# EAGLE design ECG_final_project (EAGLE 9.6.2)
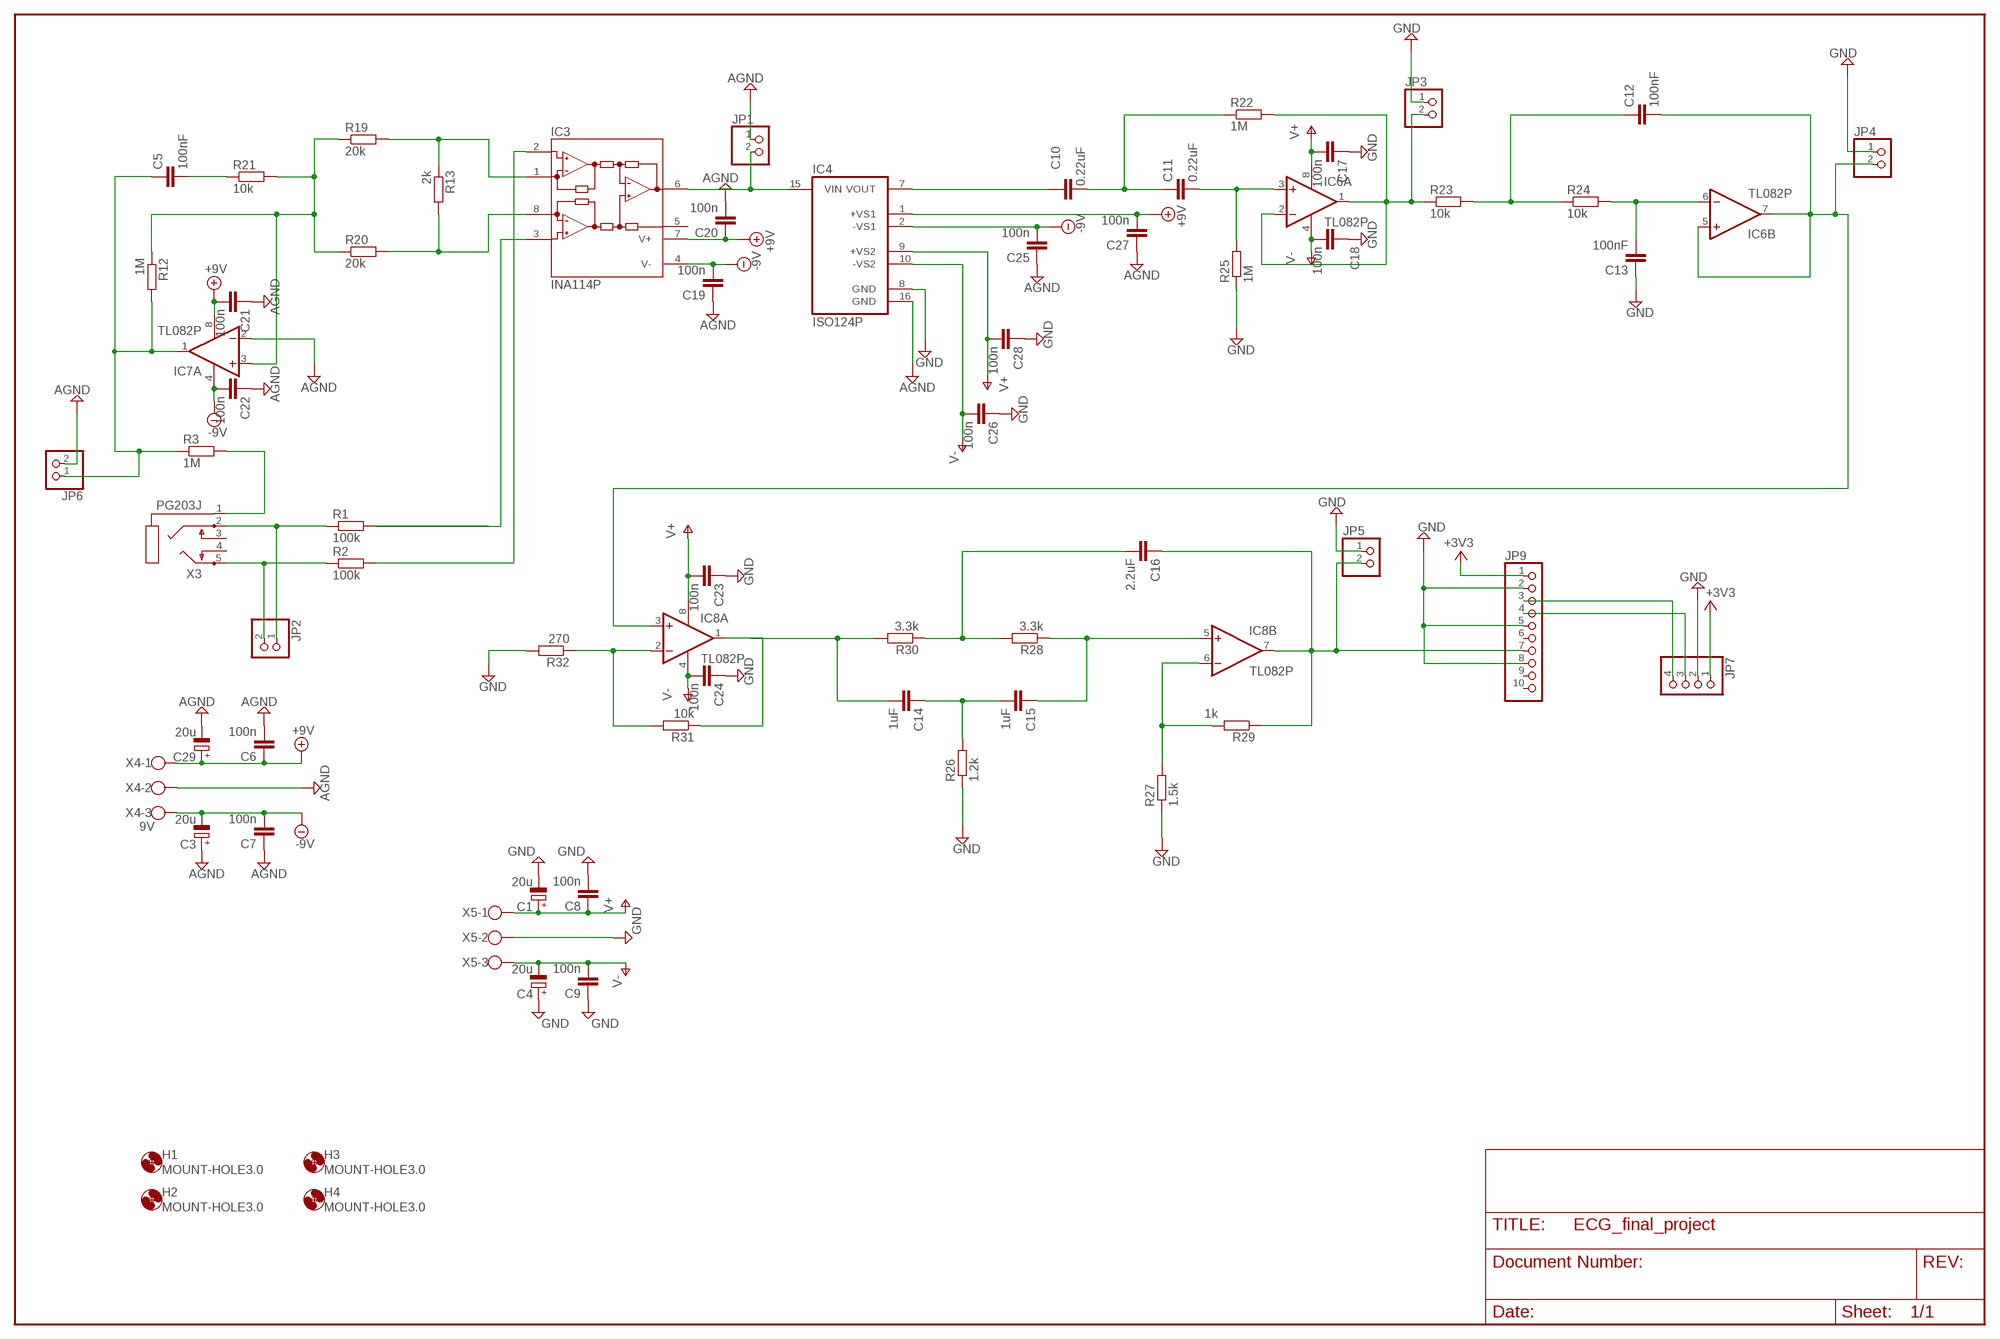
[diagram p0: schematic, sheet 1]

## Parts
C1  20u  CPOL-EUE2,5-6E  [E2,5-6E]
C3  20u  CPOL-EUE2,5-6E  [E2,5-6E]
C4  20u  CPOL-EUE2,5-6E  [E2,5-6E]
C5  100nF  C-EU025-025X050  [C025-025X050]
C6  100n  C-EU025-025X050  [C025-025X050]
C7  100n  C-EU025-025X050  [C025-025X050]
C8  100n  C-EU025-025X050  [C025-025X050]
C9  100n  C-EU025-025X050  [C025-025X050]
C10  0.22uF  C-EU025-025X050  [C025-025X050]
C11  0.22uF  C-EU025-025X050  [C025-025X050]
C12  100nF  C-EU025-025X050  [C025-025X050]
C13  100nF  C-EU025-025X050  [C025-025X050]
C14  1uF  C-EU025-025X050  [C025-025X050]
C15  1uF  C-EU025-025X050  [C025-025X050]
C16  2.2uF  C-EU025-025X050  [C025-025X050]
C17  100n  C-EU025-025X050  [C025-025X050]
C18  100n  C-EU025-025X050  [C025-025X050]
C19  100n  C-EU025-025X050  [C025-025X050]
C20  100n  C-EU025-025X050  [C025-025X050]
C21  100n  C-EU025-025X050  [C025-025X050]
C22  100n  C-EU025-025X050  [C025-025X050]
C23  100n  C-EU025-025X050  [C025-025X050]
C24  100n  C-EU025-025X050  [C025-025X050]
C25  100n  C-EU025-025X050  [C025-025X050]
C26  100n  C-EU025-025X050  [C025-025X050]
C27  100n  C-EU025-025X050  [C025-025X050]
C28  100n  C-EU025-025X050  [C025-025X050]
C29  20u  CPOL-EUE2,5-6E  [E2,5-6E]
H1  MOUNT-HOLE3.0  [3,0]
H2  MOUNT-HOLE3.0  [3,0]
H3  MOUNT-HOLE3.0  [3,0]
H4  MOUNT-HOLE3.0  [3,0]
IC3  INA114P  [DIL08]
IC4  ISO124P  [DIL16/8]
IC6  TL082P  [DIL08]
IC7  TL082P  [DIL08]
IC8  TL082P  [DIL08]
JP1  PINHD-1X2  [1X02]
JP2  PINHD-1X2  [1X02]
JP3  PINHD-1X2  [1X02]
JP4  PINHD-1X2  [1X02]
JP5  PINHD-1X2  [1X02]
JP6  PINHD-1X2  [1X02]
JP7  PINHD-1X4  [1X04]
JP9  PINHD-1X10  [1X10]
R1  100k  R-EU_0207/10  [0207/10]
R2  100k  R-EU_0207/10  [0207/10]
R3  1M  R-EU_0207/10  [0207/10]
R12  1M  R-EU_0207/10  [0207/10]
R13  2k  R-EU_0207/10  [0207/10]
R19  20k  R-EU_0207/10  [0207/10]
R20  20k  R-EU_0207/10  [0207/10]
R21  10k  R-EU_0207/10  [0207/10]
R22  1M  R-EU_0207/10  [0207/10]
R23  10k  R-EU_0207/10  [0207/10]
R24  10k  R-EU_0207/10  [0207/10]
R25  1M  R-EU_0207/10  [0207/10]
R26  1.2k  R-EU_0207/10  [0207/10]
R27  1.5k  R-EU_0207/10  [0207/10]
R28  3.3k  R-EU_0207/10  [0207/10]
R29  1k  R-EU_0207/10  [0207/10]
R30  3.3k  R-EU_0207/10  [0207/10]
R31  10k  R-EU_0207/10  [0207/10]
R32  270  R-EU_0207/10  [0207/10]
X3  PG203J  [PG203J]
X4  9V  W237-103  [W237-103]
X5  W237-103  [W237-103]

## Nets
+3V3: JP7.1 JP9.1
+9V: C6.1 C20.1 C21.2 C27.2 C29.+ IC3.7(V+) IC4.1(+VS1) IC7.8(P:V+) X4.1
-9V: C3.- C7.2 C19.2 C22.2 C25.2 IC3.4(V-) IC4.2(-VS1) IC7.4(P:V-) X4.3
AGND: C3.+ C6.2 C7.1 C19.1 C20.2 C21.1 C22.1 C25.1 C27.1 C29.- IC4.16(GND) IC7.2(A:-IN) JP1.1 JP6.2 X4.2
GND: C1.- C4.+ C8.2 C9.1 C13.1 C17.1 C18.1 C23.1 C24.1 C26.1 C28.1 IC4.8(GND) JP3.1 JP4.1 JP5.1 JP7.2 JP9.2 JP9.5 JP9.8 R25.1 R26.1 R27.1 R32.2 X5.2
N$1: IC7.3(A:+IN) R12.1 R19.1 R20.1 R21.2
N$2: C5.2 R21.1
N$3: C5.1 IC7.1(A:OUT) JP6.1 R3.1 R12.2
N$4: JP7.4 JP9.3
N$5: IC3.1(RG) R13.1 R19.2
N$6: IC3.8(RG) R13.2 R20.2
N$7: IC3.6(OUT) IC4.15(VIN) JP1.2
N$8: C10.1 IC4.7(VOUT)
N$9: C10.2 C11.1 R22.1
N$10: C11.2 IC6.3(A:+IN) R25.2
N$11: JP7.3 JP9.4
N$12: IC6.1(A:OUT) IC6.2(A:-IN) JP3.2 R22.2 R23.1
N$13: C12.1 R23.2 R24.1
N$14: C13.2 IC6.6(B:-IN) R24.2
N$15: C12.2 IC6.5(B:+IN) IC6.7(B:OUT) IC8.3(A:+IN) JP4.2
N$16: R3.2 X3.1
N$17: IC8.2(A:-IN) R31.2 R32.1
N$19: IC8.1(A:OUT) R31.1
N$21: C16.2 R28.2 R30.1
N$23: C16.1 IC8.7(B:OUT) JP5.2 JP9.7 R29.1
N$24: IC8.6(B:-IN) R27.2 R29.2
N$25: C14.2 R30.2
N$26: C14.1 C15.2 R26.2
N$27: C15.1 IC8.5(B:+IN) R28.1
N$29: IC3.2(-IN) R2.2
N$30: IC3.3(+IN) R1.2
N$31: JP2.1 R1.1 X3.2
N$32: JP2.2 R2.1 X3.5
V+: C1.+ C8.1 C17.2 C23.2 C28.2 IC4.9(+VS2) IC6.8(P:V+) IC8.8(P:V+) X5.1
V-: C4.- C9.2 C18.2 C24.2 C26.2 IC4.10(-VS2) IC6.4(P:V-) IC8.4(P:V-) X5.3
Unconnected: IC3.5(REF) IC7.5(B:+IN) IC7.6(B:-IN) IC7.7(B:OUT) JP9.6 JP9.9 JP9.10 X3.3 X3.4

## Library data of the parts
C1 C3 C4 C29 = rcl_coronas:CPOL-EU: POLARIZED CAPACITOR, European symbol; SPICEPREFIX: C
C5-C28 = rcl_coronas:C-EU: CAPACITOR, European symbol; SPICEPREFIX: C
H1-H4 = holes:MOUNT-HOLE: MOUNTING HOLE with drill center marker
IC3 = burr-brown:INA114: Precision Instrumentation Amplifier; MF: TEXAS INSTRUMENTS; MPN: INA114BP; OC_FARNELL: 1212399; OC_NEWARK: 74K3810
IC4 = burr-brown:ISO124: Isolation Amplifier Precision, Lowest Cost; MF: TEXAS INSTRUMENTS; MPN: ISO124P; OC_FARNELL: 1212425; OC_NEWARK: 35C1752
IC6-IC8 = linear:TL082: OP AMP Data sheet <http://www.ti.com/lit/ds/symlink/tl084a . pdf>; DATA_SHEET: <a href="http://www.ti.com/lit/ds/symlink/tl084a.pdf"> Data sheet </a>
JP1-JP6 = pinhead:PINHD-1X2: PIN HEADER
JP7 = pinhead:PINHD-1X4: PIN HEADER
JP9 = pinhead:PINHD-1X10: PIN HEADER
R1-R3 R12 R13 R19-R32 = rcl_coronas:R-EU_: RESISTOR, European symbol; SPICEPREFIX: R
X3 = con-hirschmann:PG203J: MIC/HEADPHONE JACK KS-S stereo microphone/headphone jack PG203JN (Schukat); OC_FARNELL: unknown; OC_NEWARK: unknown
X4 X5 = con-wago-500:W237-103: WAGO SCREW CLAMP; MPN: 237-103; OC_FARNELL: unknown; OC_NEWARK: 18M7116

## Board
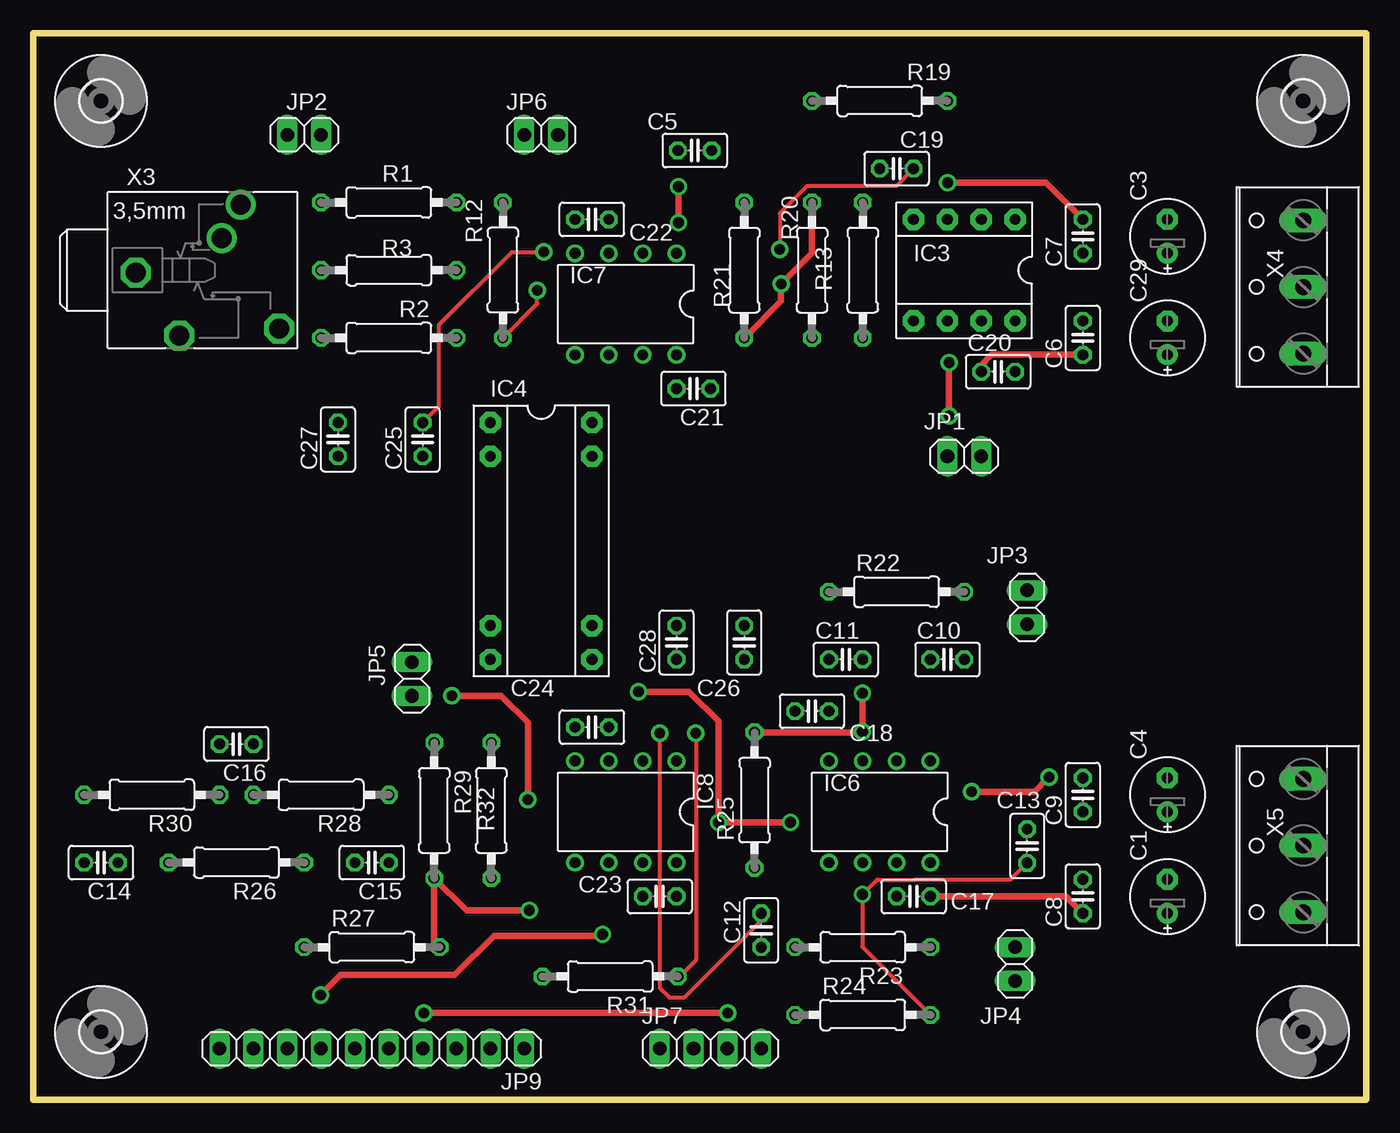
[diagram p1: board, top side]
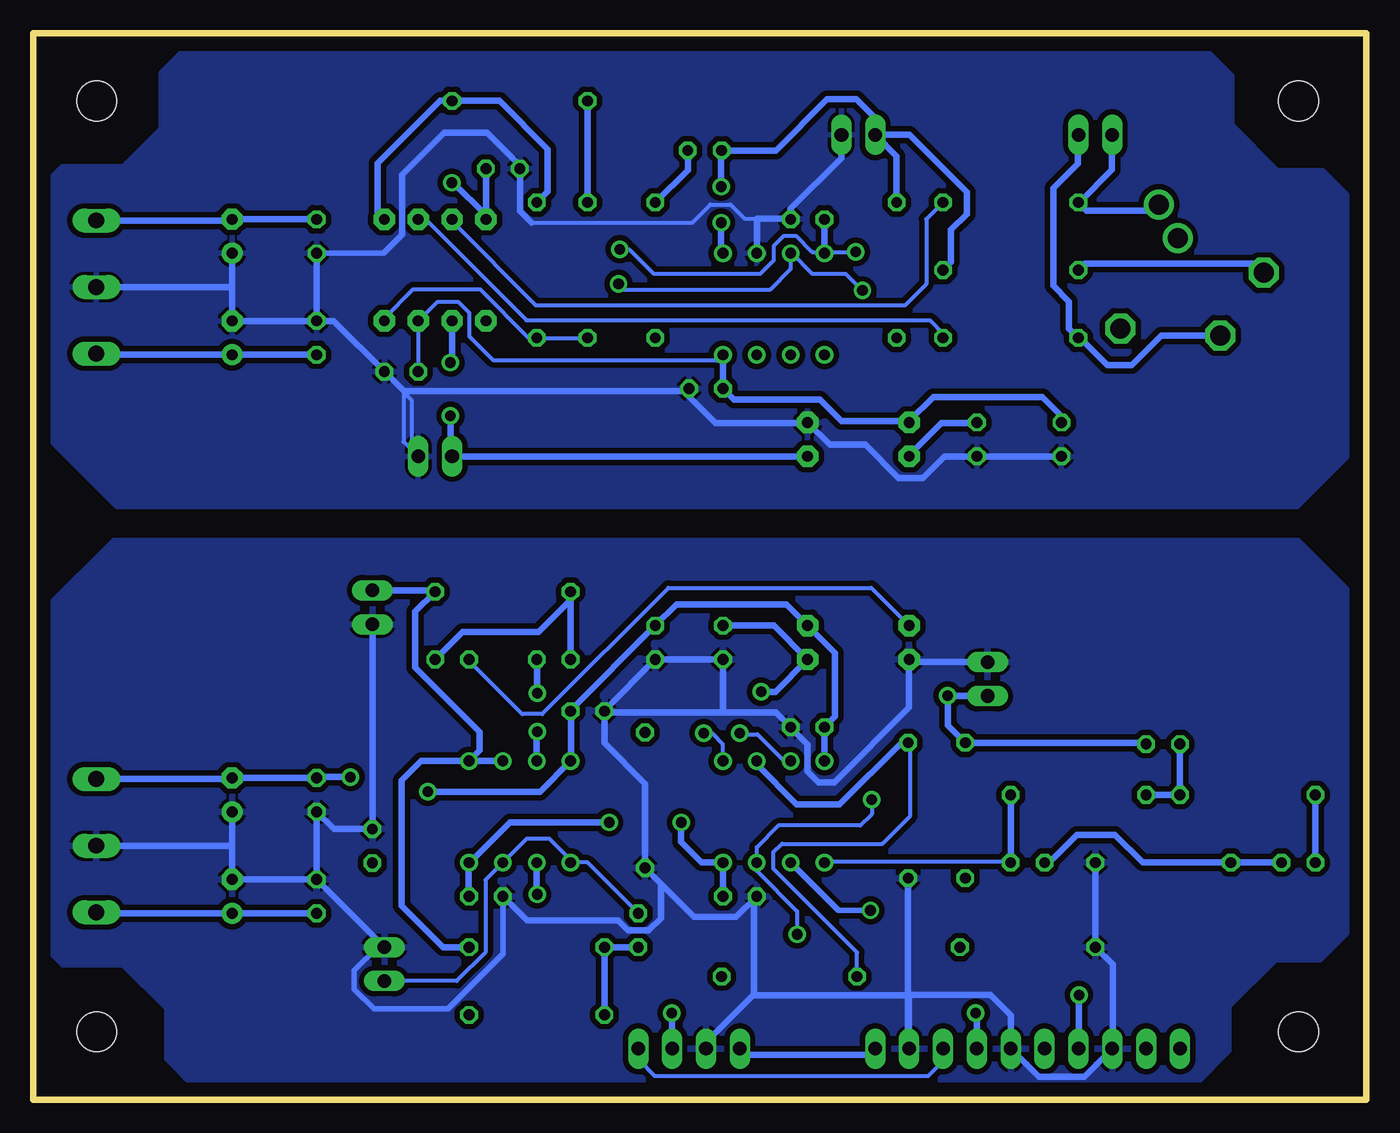
[diagram p2: board, bottom side, seen from below]

Size 100 x 80 mm. Coordinates in mm from the lower left corner, seen from the top.
Outline: 0,0 100,0 100,80 0,80 0,0
Copper layers (1*16): Top 0.035mm / dielectric 1.5mm / Bottom 0.035mm
Design rules "default": minimum track width 6mil, minimum drill 0.35mm, track to track 6mil, track to pad 6mil, pad to pad 6mil, via to via 6mil, smd to smd 6mil, copper to edge 40mil, drill to drill 6mil, minimum pad ring 10mil, minimum via ring 8mil, stop-mask expansion 4mil, vias tented up to drill 0mil, thermal gap 10mil

### Footprints (pad centres in the part's own frame; a part is rotated, then mirrored left to right if it is on the bottom)
E2,5-6E = drill 0.813 pad 1.575: + -1.27,0 | drill 0.813 pad 1.575 octagon: - 1.27,0
C025-025X050 = drill 0.813 octagon: 1 -1.27,0; 2 1.27,0
3,0 = hole 3: 0,0
DIL08 = drill 0.813 pad 1.6 octagon: 1 -3.81,-3.81; 2 -1.27,-3.81; 3 1.27,-3.81; 4 3.81,-3.81; 5 3.81,3.81; 6 1.27,3.81; 7 -1.27,3.81; 8 -3.81,3.81
DIL16/8 = drill 0.813 pad 1.6 octagon: 1 -8.89,-3.81; 2 -6.35,-3.81; 7 6.35,-3.81; 8 8.89,-3.81; 9 8.89,3.81; 10 6.35,3.81; 15 -6.35,3.81; 16 -8.89,3.81
DIL08' = drill 0.813 pad 1.27: 1 -3.81,-3.81; 2 -1.27,-3.81; 3 1.27,-3.81; 4 3.81,-3.81; 5 3.81,3.81; 6 1.27,3.81; 7 -1.27,3.81; 8 -3.81,3.81
1X02 = drill 1.016 long: 1 -1.27,0; 2 1.27,0
1X04 = drill 1.016 long: 1 -3.81,0; 2 -1.27,0; 3 1.27,0; 4 3.81,0
1X10 = drill 1.016 long: 1 -11.43,0; 2 -8.89,0; 3 -6.35,0; 4 -3.81,0; 5 -1.27,0; 6 1.27,0; 7 3.81,0; 8 6.35,0; 9 8.89,0; 10 11.43,0
0207/10 = drill 0.813 octagon: 1 -5.08,0; 2 5.08,0
PG203J = drill 1.499 octagon: 1 -5.004,-0.203; 4 5.74,-4.369; 5 -1.753,-4.902 | drill 1.499: 2 2.845,4.902; 3 1.448,2.388
W237-103 = drill 1.194 long: 1 -5,-1.29; 2 0,-1.29; 3 5,-1.29

### Placement (x,y rotation side)
C1  85.09,15.24 90 top
C3  85.09,64.77 90 top
C4  85.09,22.86 90 top
C5  49.63,71.21 0 top
C6  78.74,57.15 90 top
C7  78.74,64.77 90 top
C8  78.74,15.24 90 top
C9  78.74,22.86 90 top
C10  68.58,33.02 0 top
C11  60.96,33.02 0 top
C12  54.61,12.7 90 top
C13  74.56,19.02 270 top
C14  5.08,17.78 180 top
C15  25.4,17.78 180 top
C16  15.24,26.67 180 top
C17  66.04,15.24 0 top
C18  58.42,29.14 0 top
C19  64.77,69.85 0 top
C20  72.39,54.61 0 top
C21  49.53,53.34 180 top
C22  41.91,66.04 180 top
C23  46.99,15.24 0 top
C24  41.91,27.94 180 top
C25  29.21,49.53 90 top
C26  53.34,34.29 90 top
C27  22.86,49.53 90 top
C28  48.26,34.29 90 top
C29  85.09,57.15 90 top
H1  95.25,5.08 0 top
H2  95.25,74.93 0 top
H3  5.08,5.08 0 top
H4  5.08,74.93 0 top
IC3  69.85,62.23 180 top
IC4  38.1,41.91 270 top
IC6  TL082P  [DIL08']  63.5,21.59 180 top
IC7  TL082P  [DIL08']  44.45,59.69 180 top
IC8  TL082P  [DIL08']  44.45,21.59 180 top
JP1  69.85,48.26 180 top
JP2  20.32,72.39 0 top
JP3  74.56,36.93 90 top
JP4  73.66,10.16 270 top
JP5  28.41,31.55 270 top
JP6  38.1,72.39 0 top
JP7  50.8,3.81 0 top
JP9  25.4,3.81 180 top
R1  26.67,67.31 0 top
R2  26.67,57.15 0 top
R3  26.67,62.23 180 top
R12  35.23,62.23 90 top
R13  62.23,62.23 270 top
R19  63.5,74.93 0 top
R20  58.42,62.23 270 top
R21  53.34,62.23 270 top
R22  64.77,38.1 0 top
R23  62.23,11.43 180 top
R24  62.23,6.35 0 top
R25  54.11,22.46 90 top
R26  15.24,17.78 180 top
R27  25.4,11.43 0 top
R28  21.59,22.86 180 top
R29  30.08,21.69 270 top
R30  8.89,22.86 180 top
R31  43.28,9.23 180 top
R32  34.36,21.69 270 top
X3  12.7,62.23 0 top
X4  93.98,60.96 90 top
X5  93.98,19.05 90 top

### Tracks (layer width: path | path; a pad name or v marks a point on that pad's centre or on a via)
+3V3
  Bottom 0.5: JP9.1 37.3,3.34 46.52,3.34 JP7.1
+9V
  Top 0.5: C20.1 71.12,55.11 71.89,55.88 C6.1
  Bottom 0.3: 48.65,55.49 65.51,55.49 67.28,57.26 67.28,59.02 68.08,59.82 69.72,59.82 IC3.7 C20.1
  Bottom 0.4: IC7.8 48.65,55.49 | IC4.1 34.39,50.9 34.7,50.9
  Bottom 0.5: 78.64,55.93 C6.1 C29.+ 95.19,55.88 X4.1 | C27.2 22.86,51.3 24.28,52.72 32.48,52.72 34.29,50.9 34.7,50.9 39.36,50.9 40.98,52.53 47.45,52.53 C21.2 IC7.8
-9V  (via drill 0.8 pad 1.3)
  Top 0.3: v56,63.8 56,66.49 58.06,68.55 64.74,68.55 C19.2 | v38.3,63.6 35.9,63.6 30.41,58.11 30.41,52 C25.2
  Top 0.5: v68.6,68.8 75.98,68.8 C7.2
  Bottom 0.3: 40.54,63.6 v38.3,63.6 | 40.74,63.6 41.58,63.6 42.74,64.76 43.72,64.76 44.46,64.03 44.46,62.96 45.48,61.94 53.44,61.94 55.3,63.8 v56,63.8
  Bottom 0.5: C25.2 29.26,50.75 31.85,50.75 34.29,48.31 IC4.2 | X4.3 85.17,65.96 C3.- C7.2 | C22.2 40.64,63.7 40.54,63.6 IC7.4 40.74,63.6 | C19.2 IC3.4 66.04,66.34 68.5,68.8 v68.6,68.8
AGND
  Bottom 0.3: 62.64,65.79 50.56,65.79 49.19,67.15 47.71,67.15 46.64,66.09 45.72,66.09 | 72.02,52.9 71.62,52.5 71.62,48.76 JP1.1 72.22,49.36 72.22,53.11 72.19,53.14
  Bottom 0.4: 72.33,64.9 73.73,63.5 C7.1 | C19.1 63.5,70.07 | 39.38,72.18 39.37,72.19 JP6.2
  Bottom 0.5: 71.22,48.26 JP1.1 | X4.2 85.09,60.96 | 85.09,60.96 C3.+ | 85.09,60.96 C29.- C6.2 | C27.1 C25.1 31.64,48.26 33.26,46.63 35.08,46.63 37.58,49.13 40.24,49.13 IC4.16 41.96,50.75 48.81,50.75 50.8,52.74 C21.1 51,53.14 72.02,53.14 72.02,52.9 | C7.1 C6.2 | C6.2 77.47,58.42 C20.2 72.19,53.14 | 63.5,70.07 65.97,72.54 69.18,72.54 72.33,69.38 72.33,64.9 | IC7.2 45.72,66.09 43.23,66.09 C22.1 43.18,66.84 39.38,70.64 39.38,72.18 | 62.64,65.79 63.5,66.65 C19.1
  pour Bottom (isolate 0.406): 88.9,78.5 11.8,78.5 10.1,76.8 10.1,73.1 6.7,69.7 3.3,69.7 1.2,67.6 1.2,48.5 5.2,44.5 93.7,44.5 98.8,49.6 98.8,69 97.8,70 93.2,70 90.4,72.8 90.4,77
GND
  Bottom 0.4: C17.1 64.77,10.92 68.89,6.8 74.43,6.8 75.91,8.28 75.91,9.7 74.18,11.43 | JP7.2 49.53,4.31 46.01,7.83 45.3,7.83
  Bottom 0.5: 34.39,7.83 34.39,3.91 JP9.2 34.29,7.86 28.2,7.86 26.67,6.33 JP9.5 24.57,1.71 21.15,1.71 JP9.8 19.02,3.84 19.02,10.13 R27.1 R26.1 | 34.39,7.83 34.39,16.58 R32.2 | 54.21,17.38 R25.1 | X5.2 85.09,19.05 C4.+ C1.- C8.2 | C8.2 C9.1 77.44,20.29 C13.1 JP3.1 | JP5.1 34.09,32.82 IC4.8 34.29,29.42 39.91,23.8 41.1,23.8 41.9,24.6 41.9,26.63 43.18,27.91 C24.1 44.28,29.04 48.26,29.04 C28.1 | C18.1 57.04,29.03 48.26,29.03 C28.1 | C28.1 C26.1 57.15,29.21 C18.1 | C18.1 57.15,26.74 54.11,23.7 R25.1 | R25.1 50.42,13.69 47.27,13.69 C23.1 45.92,15.04 45.92,7.83 45.3,7.83 34.39,7.83 | C17.1 62.97,13.44 56.14,13.44 55.38,12.68 53.84,12.68 52.92,13.6 52.92,16.19 R25.1 | 74.18,11.43 JP4.1 C8.2 | JP7.2 49.53,3.98
  pour Bottom (isolate 0.406): 5.08,41.91 93.98,41.91 99.06,36.83 99.06,11.43 97.79,10.16 93.28,10.16 89.97,6.85 89.97,3.04 88.2,1.27 12.7,1.27 10.33,3.64 10.33,6.98 6.78,10.53 3.44,10.53 1.27,12.7 1.27,38.1
N$1  (via drill 0.8 pad 1.3)
  Top 0.3: R12.1 37.8,59.72 v37.8,60.7
  Top 0.5: R20.1 58.42,63.52 v56.1,61.2 56.1,59.91 R21.2
  Bottom 0.3: v37.8,60.7 39.04,61.94 41.54,61.94 43.1,63.5 | IC7.3 43.18,62.31 44.71,60.78 55.69,60.78 v56.1,61.2
  Bottom 0.5: R19.1 R20.1 | 43.1,63.5 IC7.3
N$2
  Bottom 0.5: R21.1 50.9,69.75 C5.2
N$3  (via drill 0.8 pad 1.3)
  Top 0.5: v48.4,68.5 v48.4,65.8
  Bottom 0.152: JP6.1
  Bottom 0.5: R3.1 31.15,62.83 31.15,65.25 29.96,66.44 29.96,68.08 34.28,72.4 JP6.1 | JP6.1 36.83,72.19 | JP6.1 35.23,70.79 R12.2 | JP6.1 36.83,73.61 38.26,75.04 40.46,75.04 44.29,71.21 C5.1 48.4,71.17 v48.4,68.5 | v48.4,65.8 48.4,63.64 IC7.1
N$4
  Bottom 0.3: JP9.3 31.75,2.89 32.88,1.75 53.35,1.75 54.61,3.01 JP7.4
N$5
  Bottom 0.5: R13.1 61.41,68.13 61.41,71.32 65.02,74.93 R19.2 69.48,74.93 74.16,70.25 74.16,66.54 IC3.1
N$6
  Bottom 0.3: 73.66,58.62 71.49,60.79 66.47,60.79 62.83,57.15 R13.2 R20.2
  Bottom 0.5: IC3.8 73.66,58.62
N$7  (via drill 0.8 pad 1.3)
  Top 0.5: v68.7,55.3 v68.7,51.3
  Bottom 0.5: IC4.15 JP1.2 68.7,48.38 v68.7,51.3 | IC3.6 68.58,55.42 v68.7,55.3
N$8
  Bottom 0.3: IC4.7 37.13,38.4 52.35,38.4 61.82,28.93 63.32,28.93 67.31,32.92 C10.1
N$9
  Bottom 0.5: C11.1 R22.1 59.69,37.5 62.1,35.09 67.78,35.09 C10.2
N$10  (via drill 0.8 pad 1.3)
  Top 0.5: R25.2 62.14,27.54 v62.2,27.6 v62.2,30.5
  Bottom 0.5: v62.2,27.6 62.23,27.57 IC6.3 | v62.2,30.5 62.2,32.99 C11.2
N$11  (via drill 0.8 pad 1.3)
  Top 0.5: v29.3,6.5 v52.1,6.5
  Bottom 0.5: JP9.4 29.21,6.41 v29.3,6.5 | v52.1,6.5 52.1,3.84 JP7.3
N$12
  Bottom 0.5: JP3.2 69.95,38.2 R22.2 71.34,36.61 71.34,32.43 66.51,27.6 66.51,26.2 IC6.1 | IC6.1 70.91,25.4 72.38,23.93 72.38,14.54 69.27,11.43 R23.1 | IC6.1 IC6.2
N$13
  Bottom 0.5: C12.1 R23.2 R24.1
N$14  (via drill 0.8 pad 1.3)
  Top 0.3: C13.2 73.31,16.5 66.14,16.5 63.3,16.5 v62.2,15.4 62.2,11.46 R24.2
  Bottom 0.5: IC6.6 62.23,15.43 v62.2,15.4
N$15  (via drill 0.8 pad 1.3)
  Top 0.3: C12.2 54.61,13.42 48.85,7.67 47.72,7.67 47,8.39 v47,27.5
  Top 0.5: 47.04,27.46 v47,27.5
  Bottom 0.3: JP4.2 68.23,8.89 66.08,11.04 66.08,16.46 IC6.7 | IC6.7 62.97,19.58 61.29,19.58 59.69,17.98 IC6.5 58.42,17.78 C12.2 | IC8.3 43.68,25.4 45.68,27.4 46.9,27.4
  Bottom 0.5: IC6.7 | v47,27.5 46.9,27.4
N$16
  Bottom 0.5: X3.1 8.4,62.73 21.09,62.73 R3.2
N$17
  Bottom 0.3: R31.2 38.2,11.03 44.5,17.33 44.5,18.53 43.83,19.2 36.3,19.2 34.2,21.3 34.2,26.61
  Bottom 0.5: R32.1 34.66,27.07 | 34.2,26.61 R32.1 | R32.1 34.88,26.77 39.5,22.15 42.73,22.15 45.72,25.14 IC8.2
N$19  (via drill 0.8 pad 1.3)
  Top 0.3: v49.7,27.5 49.7,10.44 48.43,9.16
  Top 0.5: R31.1 48.43,9.16
  Bottom 0.3: IC8.1 48.26,26.66 49.1,27.5 v49.7,27.5
N$21
  Bottom 0.5: C16.2 R30.1 R28.2
N$23  (via drill 0.8 pad 1.3)
  Top 0.5: v37.1,22.5 37.1,28.3 35.1,30.3 v31.4,30.3 | v42.7,12.4 42.6,12.3 34.55,12.3 31.62,9.37 23.07,9.37 v21.55,7.85
  Bottom 0.3: v42.7,12.4 42.7,14.12 45.72,17.14 IC8.7 45.72,18.93 44.1,20.55 37.95,20.55 37.1,21.4 v37.1,22.5
  Bottom 0.5: C16.1 16.61,26.77 R29.1 31.38,28.07 31.38,30.28 | 21.5,3.9 JP9.7 21.55,3.85 v21.55,7.85 | JP5.2 31.38,30.28 | 31.38,30.28 v31.4,30.3
N$24  (via drill 0.8 pad 1.3)
  Top 0.5: R27.2 30.08,11.83 R29.2 32.49,14.2 v37.2,14.2
  Bottom 0.4: IC8.6 39.6,14.2 v37.2,14.2
N$25
  Bottom 0.5: R30.2 C14.2
N$26
  Bottom 0.5: C14.1 R26.2 16.76,17.78 18.85,19.87 21.69,19.87 23.78,17.78 C15.2
N$27
  Bottom 0.3: IC8.5 40.54,17.88 26.77,17.88
  Bottom 0.4: C15.1 26.77,17.88
  Bottom 0.5: R28.1 C15.1
N$29
  Bottom 0.3: R2.2 32.05,57.45 31.71,57.45 32.73,58.47 63,58.47 70.57,66.04 IC3.2
N$30
  Bottom 0.3: IC3.3 68.58,65.89 62.27,59.58 34.62,59.58 33,61.2 33,66.06 R1.2
  Bottom 0.5: 31.75,67.21 R1.2
N$31
  Bottom 0.5: X3.2 15.97,66.71 20.99,66.71 R1.1 21.52,67.31 19.07,69.77 19.07,72.37 JP2.1
N$32
  Bottom 0.5: JP2.2 21.62,72.36 21.62,70.24 23.48,68.38 23.48,61.06 22.29,59.87 22.29,57.85 R2.1 21.44,57.15 19.4,55.11 17.58,55.11 15.36,57.33 X3.5
V+  (via drill 0.8 pad 1.3)
  Top 0.5: C17.2 77.47,15.24 C8.1 | v45.4,30.6 49.2,30.6 51.4,28.4 v51.4,20.8 56.7,20.8 56.75,20.85 v56.8,20.8
  Bottom 0.5: 67.36,17.68 67.36,15.24 C17.2 | 67.36,17.68 IC6.8 | 78.64,14.02 C8.1 C1.+ 95.19,13.97 X5.1 | v56.8,20.8 64.24,20.8 67.36,17.68 | C28.2 44.45,35.56 IC4.9 44.33,30.6 v45.4,30.6 | v51.4,20.8 51.4,19.32 49.86,17.78 IC8.8 C23.2
V-  (via drill 0.8 pad 1.3)
  Top 0.5: v76.2,24.2 75.1,23.1 v70.4,23.1
  Bottom 0.5: X5.3 85.17,24.05 C4.- C9.2 78.67,24.2 v76.2,24.2 | IC8.4 C24.2 39.84,28.74 39.84,33.49 IC4.10 43.5,37.15 51.75,37.15 C26.2 59.69,29.21 C18.2 59.64,29.09 59.64,25.45 IC6.4 61.99,23.1 v70.4,23.1

### Text on the board
tValues: ELECTROCARDIOGRAMA | EVA CIRUJEDA | DISEÑO ELECTRONICO